# EAGLE schematic astra (EAGLE 9.6.2)

## Sheet 1 of 7: System architecture and design index
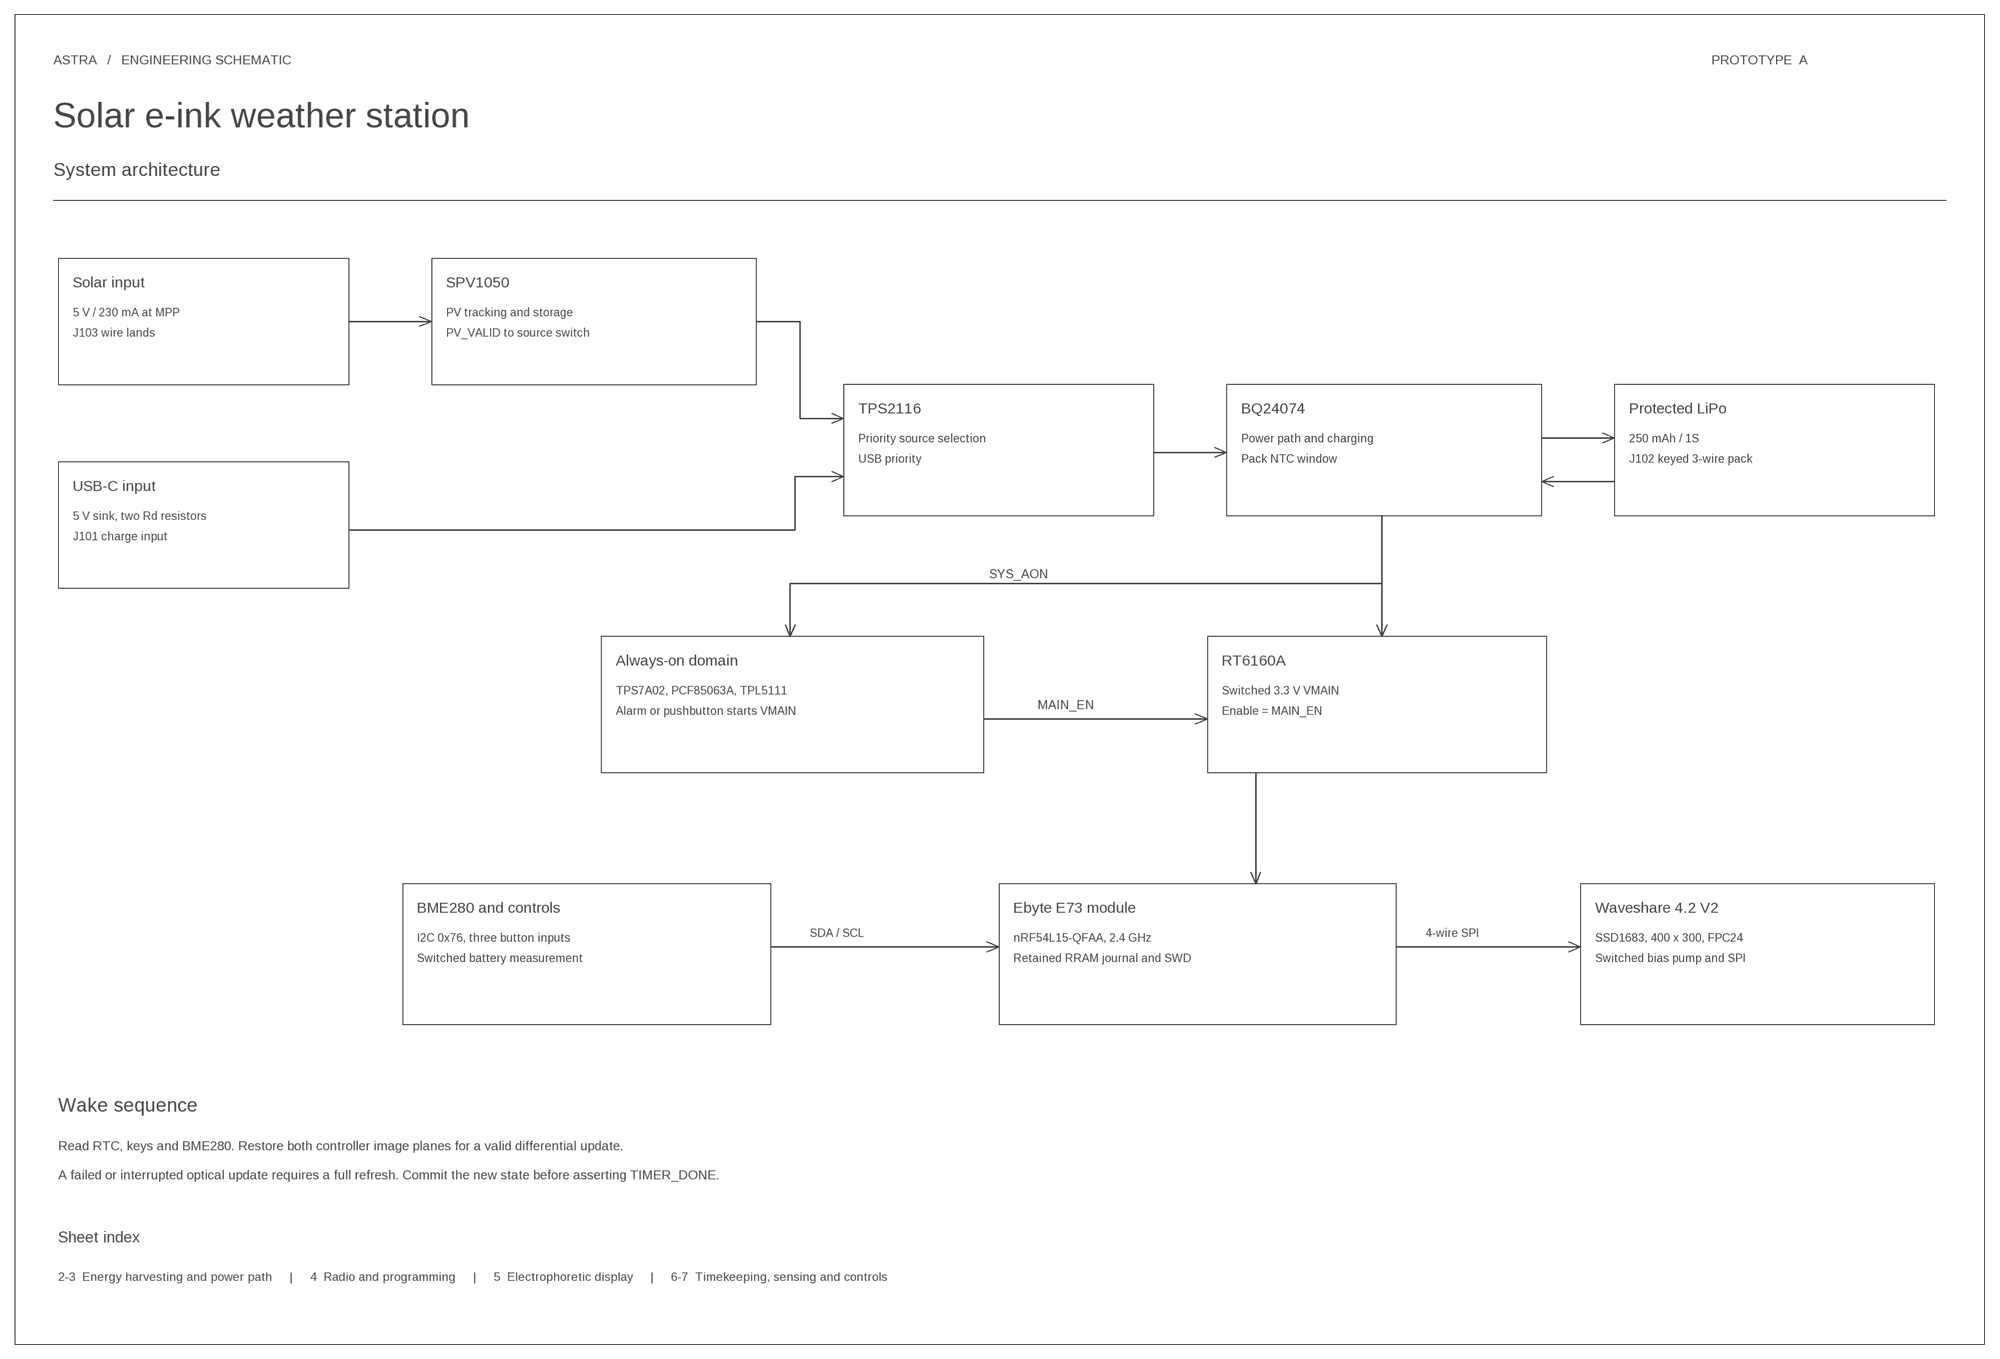
[diagram p0: schematic, sheet 1]

### Notes on the sheet
- ASTRA   /   ENGINEERING SCHEMATIC | PROTOTYPE  A
- Solar e-ink weather station
- System architecture
- Solar input | SPV1050
- 5 V / 230 mA at MPP | PV tracking and storage
- J103 wire lands | PV_VALID to source switch
- TPS2116 | BQ24074 | Protected LiPo
- Priority source selection | Power path and charging | 250 mAh / 1S
- USB priority | Pack NTC window | J102 keyed 3-wire pack
- USB-C input
- 5 V sink, two Rd resistors
- J101 charge input
- SYS_AON
- Always-on domain | RT6160A
- TPS7A02, PCF85063A, TPL5111 | Switched 3.3 V VMAIN
- MAIN_EN
- Alarm or pushbutton starts VMAIN | Enable = MAIN_EN
- BME280 and controls | Ebyte E73 module | Waveshare 4.2 V2
- SDA / SCL | 4-wire SPI
- I2C 0x76, three button inputs | nRF54L15-QFAA, 2.4 GHz | SSD1683, 400 x 300, FPC24
- Switched battery measurement | Retained RRAM journal and SWD | Switched bias pump and SPI
- Wake sequence
- Read RTC, keys and BME280. Restore both controller image planes for a valid differential update.
- A failed or interrupted optical update requires a full refresh. Commit the new state before asserting TIMER_DONE.
- Sheet index
- 2-3  Energy harvesting and power path     |     4  Radio and programming     |     5  Electrophoretic display     |     6-7  Timekeeping, sensing and controls

## Sheet 2 of 7: USB-C, battery charging and system rail
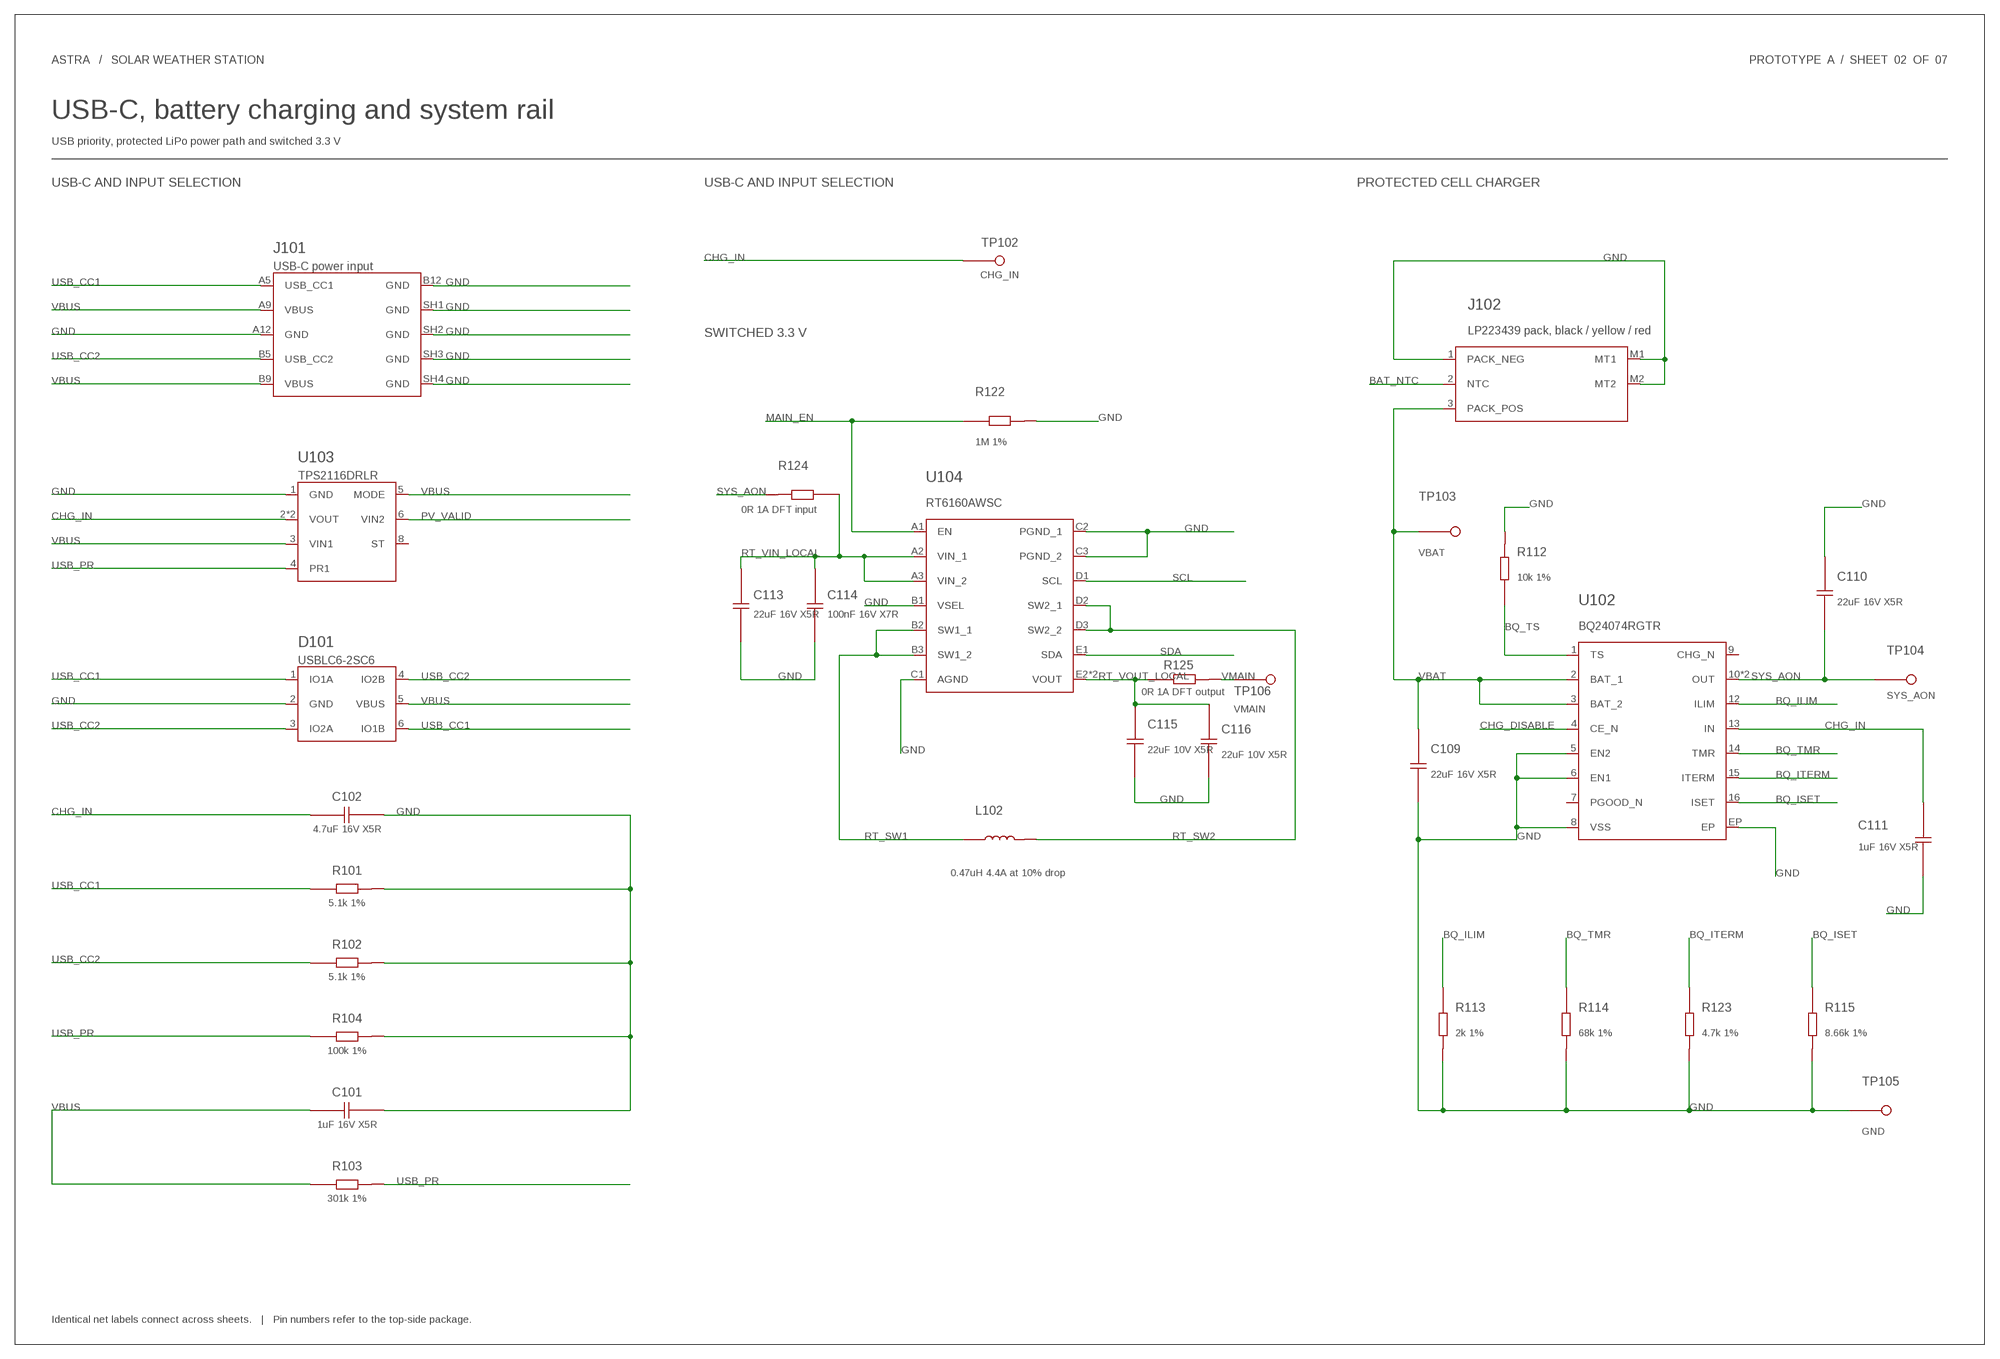
[diagram p1: schematic, sheet 2]

### Parts
C101  1uF 16V X5R  C_C0402  [C0402]
C102  4.7uF 16V X5R  C_C0603  [C0603]
C109  22uF 16V X5R  C_C0603  [C0603]
C110  22uF 16V X5R  C_C0603  [C0603]
C111  1uF 16V X5R  C_C0402  [C0402]
C113  22uF 16V X5R  C_C0603  [C0603]
C114  100nF 16V X7R  C_C0402  [C0402]
C115  22uF 10V X5R  C_C0603  [C0603]
C116  22uF 10V X5R  C_C0603  [C0603]
D101  USBLC6-2SC6  [ST_SOT23_6_ESD]
J101  USB-C power input  USB4135-GF-A  [GCT_USB4135]
J102  LP223439 pack, black / yellow / red  BM03B-ACHSS-GAN-ETF_LF__SN  [JST_ACH03P_POWER]
L102  0.47uH 4.4A at 10% drop  L_COIL_XGL4015  [COIL_XGL4015]
R101  5.1k 1%  R_R0402  [R0402]
R102  5.1k 1%  R_R0402  [R0402]
R103  301k 1%  R_R0402  [R0402]
R104  100k 1%  R_R0402  [R0402]
R112  10k 1%  R_R0402  [R0402]
R113  2k 1%  R_R0402  [R0402]
R114  68k 1%  R_R0402  [R0402]
R115  8.66k 1%  R_R0402  [R0402]
R122  1M 1%  R_R0402  [R0402]
R123  4.7k 1%  R_R0402  [R0402]
R124  0R 1A DFT input  R_R0603  [R0603]
R125  0R 1A DFT output  R_R0603  [R0603]
TP102  CHG_IN  TP_TP  [TP]
TP103  VBAT  TP_TP  [TP]
TP104  SYS_AON  TP_TP  [TP]
TP105  GND  TP_TP  [TP]
TP106  VMAIN  TP_TP  [TP]
U102  BQ24074RGTR  [TI_RGT16_BQ74]
U103  TPS2116DRLR  [TI_DRL8_MUX]
U104  RT6160AWSC  [RT_WLCSP15]

### Nets
BAT_NTC: J102.2(NTC) ; also sheet 3
BQ_ILIM: R113.1 U102.12(ILIM)
BQ_ISET: R115.1 U102.16(ISET)
BQ_ITERM: R123.1 U102.15(ITERM)
BQ_TMR: R114.1 U102.14(TMR)
BQ_TS: R112.1 U102.1(TS)
CHG_DISABLE: U102.4(CE_N) ; also sheet 3
CHG_IN: C102.1 C111.1 TP102.1 U102.13(IN) U103.2(VOUT) U103.7(VOUT) ; also sheet 3
GND: C101.2 C102.2 C109.2 C110.2 C111.2 C113.2 C114.2 C115.2 C116.2 D101.2(GND) J101.A12(GND) J101.B12(GND) J101.SH1(GND) J101.SH2(GND) J101.SH3(GND) J101.SH4(GND) J102.1(PACK_NEG) J102.M1(MT1) J102.M2(MT2) R101.2 R102.2 R104.2 R112.2 R113.2 R114.2 R115.2 R122.2 R123.2 TP105.1 U102.5(EN2) U102.6(EN1) U102.8(VSS) U102.EP U103.1(GND) U104.B1(VSEL) U104.C1(AGND) U104.C2(PGND_1) U104.C3(PGND_2) ; also sheet 3,4,5,6,7
MAIN_EN: R122.1 U104.A1(EN) ; also sheet 6,7
PV_VALID: U103.6(VIN2) ; also sheet 3
RT_SW1: L102.1 U104.B2(SW1_1) U104.B3(SW1_2)
RT_SW2: L102.2 U104.D2(SW2_1) U104.D3(SW2_2)
RT_VIN_LOCAL: C113.1 C114.1 R124.1 U104.A2(VIN_1) U104.A3(VIN_2)
RT_VOUT_LOCAL: C115.1 C116.1 R125.1 U104.E2(VOUT) U104.E3(VOUT)
SCL: U104.D1(SCL) ; also sheet 4,6
SDA: U104.E1(SDA) ; also sheet 4,6
SYS_AON [power]: C110.1 R124.2 TP104.1 U102.10(OUT) U102.11(OUT) ; also sheet 6
USB_CC1: D101.1(IO1A) D101.6(IO1B) J101.A5(USB_CC1) R101.1
USB_CC2: D101.3(IO2A) D101.4(IO2B) J101.B5(USB_CC2) R102.1
USB_PR: R103.2 R104.1 U103.4(PR1)
VBAT [power]: C109.1 J102.3(PACK_POS) TP103.1 U102.2(BAT_1) U102.3(BAT_2) ; also sheet 7
VBUS [power]: C101.1 D101.5(VBUS) J101.A9(VBUS) J101.B9(VBUS) R103.1 U103.3(VIN1) U103.5(MODE)
VMAIN [power]: R125.2 TP106.1 ; also sheet 4,5,6,7
Unconnected: U102.7(PGOOD_N) U102.9(CHG_N) U103.8(ST)

### Notes on the sheet
- ASTRA   /   SOLAR WEATHER STATION | PROTOTYPE  A  /  SHEET  02  OF  07
- USB-C, battery charging and system rail
- USB priority, protected LiPo power path and switched 3.3 V
- USB-C AND INPUT SELECTION | USB-C AND INPUT SELECTION | PROTECTED CELL CHARGER
- SWITCHED 3.3 V
- Identical net labels connect across sheets.   |   Pin numbers refer to the top-side package.

## Sheet 3 of 7: Solar harvesting and pack temperature
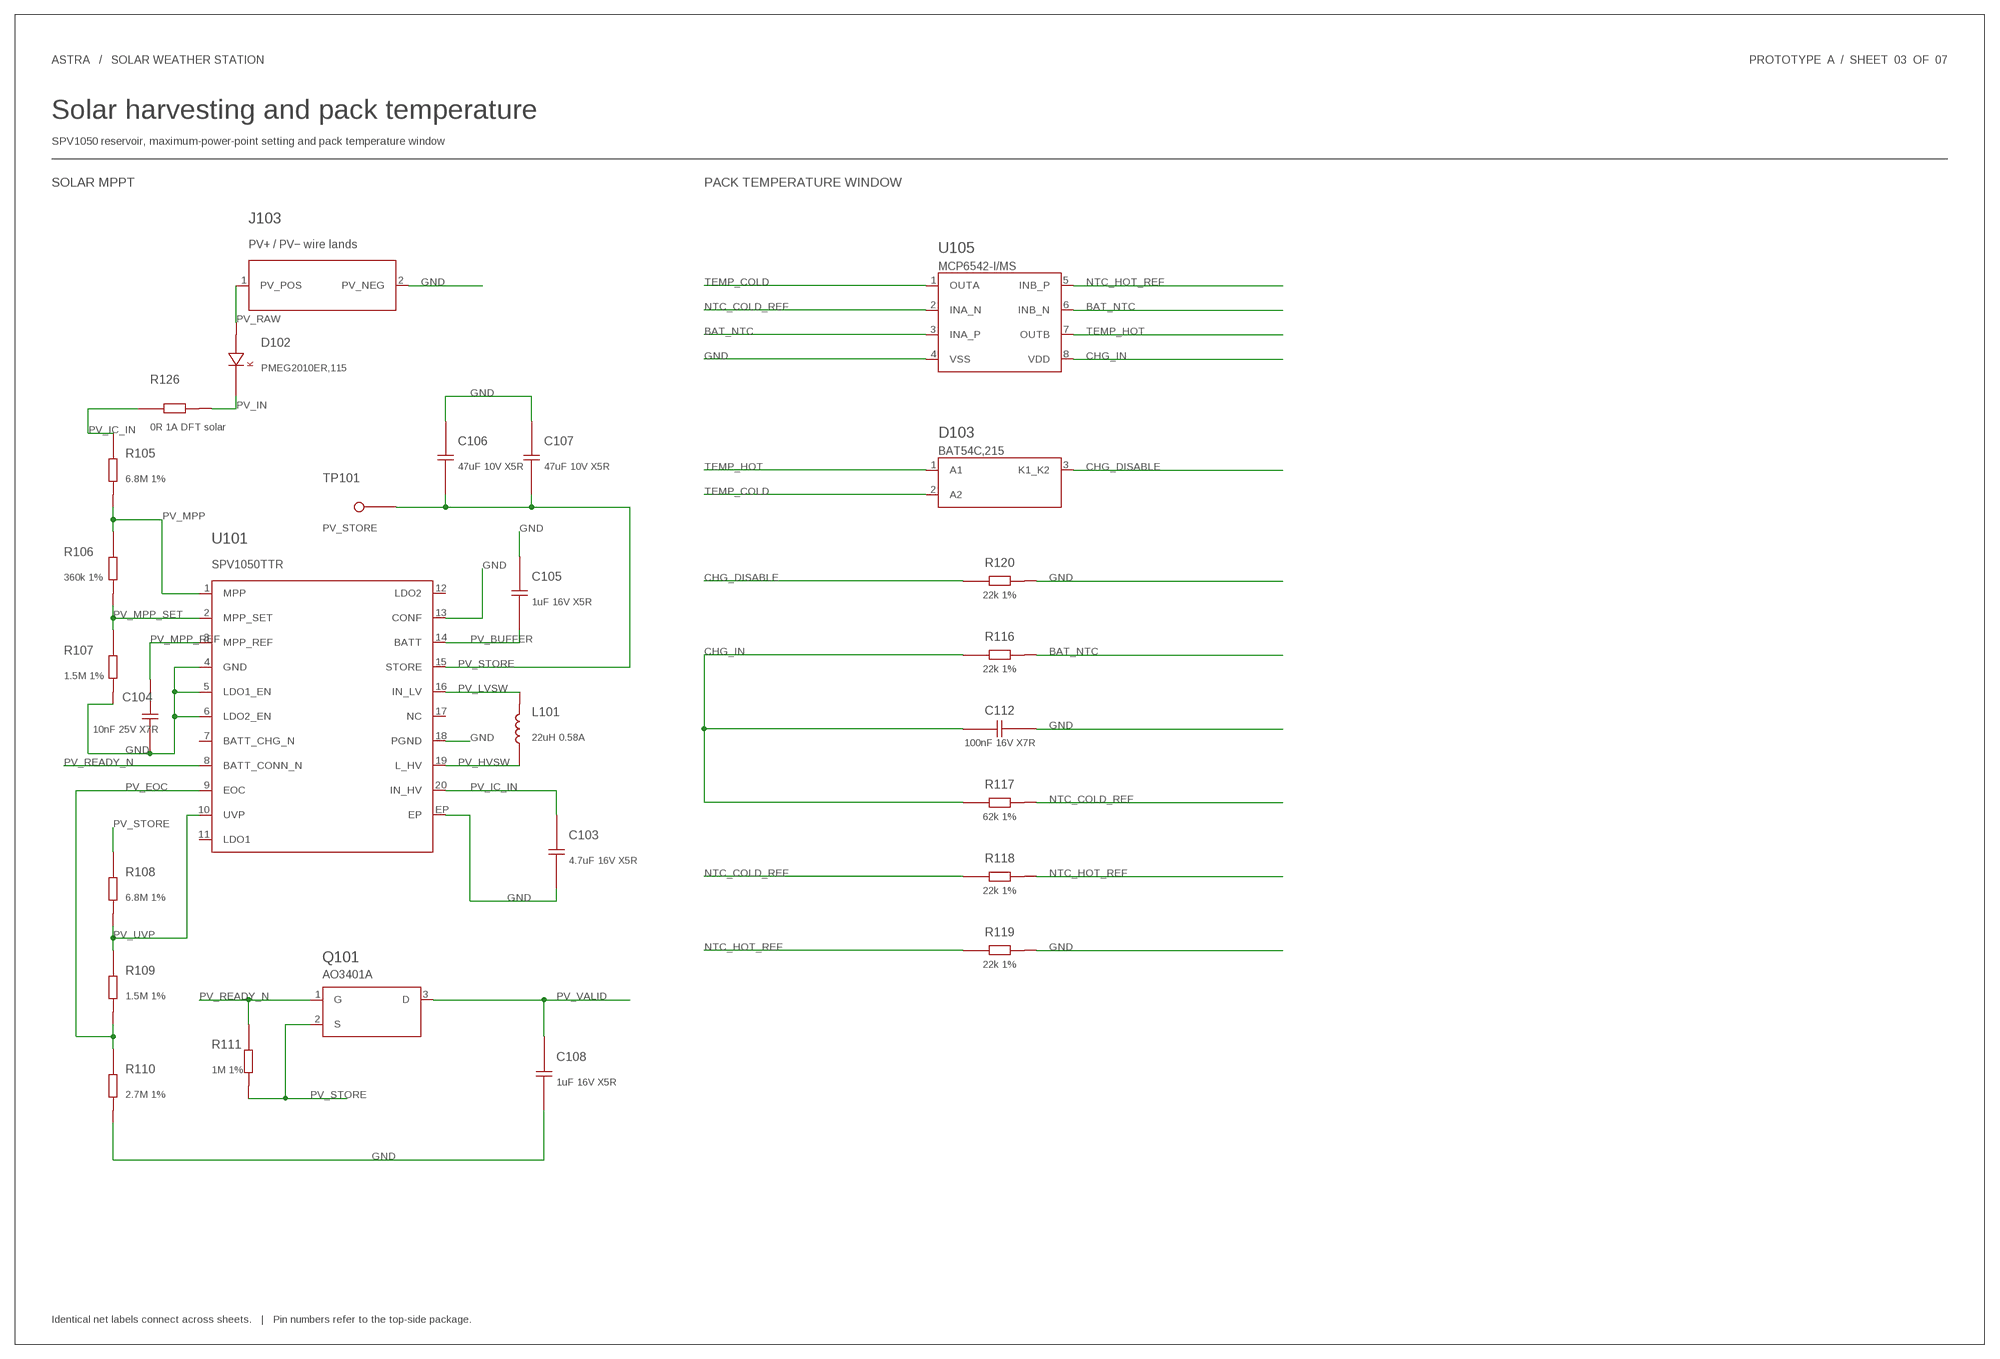
[diagram p2: schematic, sheet 3]

### Parts
C103  4.7uF 16V X5R  C_C0603  [C0603]
C104  10nF 25V X7R  C_C0402  [C0402]
C105  1uF 16V X5R  C_C0402  [C0402]
C106  47uF 10V X5R  C_C1206P  [C1206P]
C107  47uF 10V X5R  C_C1206P  [C1206P]
C108  1uF 16V X5R  C_C0402  [C0402]
C112  100nF 16V X7R  C_C0402  [C0402]
D102  PMEG2010ER,115  D_NXP_CFP3_DIODE  [NXP_CFP3_DIODE]
D103  BAT54C,215  BAT54C_215  [NXP_SOT23_DIODE]
J103  PV+ / PV− wire lands  PCB-FEATURE  [PV_WIRE_PAIR]
L101  22uH 0.58A  L_BOURNS_SRN3015  [BOURNS_SRN3015]
Q101  AO3401A  [SOT23_AO3401A]
R105  6.8M 1%  R_R0402  [R0402]
R106  360k 1%  R_R0402  [R0402]
R107  1.5M 1%  R_R0402  [R0402]
R108  6.8M 1%  R_R0402  [R0402]
R109  1.5M 1%  R_R0402  [R0402]
R110  2.7M 1%  R_R0402  [R0402]
R111  1M 1%  R_R0402  [R0402]
R116  22k 1%  R_R0402  [R0402]
R117  62k 1%  R_R0402  [R0402]
R118  22k 1%  R_R0402  [R0402]
R119  22k 1%  R_R0402  [R0402]
R120  22k 1%  R_R0402  [R0402]
R126  0R 1A DFT solar  R_R0603  [R0603]
TP101  PV_STORE  TP_TP  [TP]
U101  SPV1050TTR  [SPV_VFQFPN20]
U105  MCP6542-I/MS  [MC_MSOP8_TEMP]

### Nets
BAT_NTC: R116.2 U105.3(INA_P) U105.6(INB_N) ; also sheet 2
CHG_DISABLE: D103.3(K1_K2) R120.1 ; also sheet 2
CHG_IN: C112.1 R116.1 R117.1 U105.8(VDD) ; also sheet 2
GND: C103.2 C104.2 C105.2 C106.2 C107.2 C108.2 C112.2 J103.2(PV_NEG) R107.2 R110.2 R119.2 R120.2 U101.4(GND) U101.5(LDO1_EN) U101.6(LDO2_EN) U101.13(CONF) U101.18(PGND) U101.EP U105.4(VSS) ; also sheet 2,4,5,6,7
NTC_COLD_REF: R117.2 R118.1 U105.2(INA_N)
NTC_HOT_REF: R118.2 R119.1 U105.5(INB_P)
PV_BUFFER: C105.1 U101.14(BATT)
PV_EOC: R109.2 R110.1 U101.9(EOC)
PV_HVSW: L101.1 U101.19(L_HV)
PV_IC_IN: C103.1 R105.1 R126.1 U101.20(IN_HV)
PV_IN [power]: D102.1(K) R126.2
PV_LVSW: L101.2 U101.16(IN_LV)
PV_MPP: R105.2 R106.1 U101.1(MPP)
PV_MPP_REF: C104.1 U101.3(MPP_REF)
PV_MPP_SET: R106.2 R107.1 U101.2(MPP_SET)
PV_RAW: D102.2(A) J103.1(PV_POS)
PV_READY_N: Q101.1(G) R111.1 U101.8(BATT_CONN_N)
PV_STORE: C106.1 C107.1 Q101.2(S) R108.1 R111.2 TP101.1 U101.15(STORE)
PV_UVP: R108.2 R109.1 U101.10(UVP)
PV_VALID: C108.1 Q101.3(D) ; also sheet 2
TEMP_COLD: D103.2(A2) U105.1(OUTA)
TEMP_HOT: D103.1(A1) U105.7(OUTB)
Unconnected: U101.7(BATT_CHG_N) U101.11(LDO1) U101.12(LDO2) U101.17(NC)

### Notes on the sheet
- ASTRA   /   SOLAR WEATHER STATION | PROTOTYPE  A  /  SHEET  03  OF  07
- Solar harvesting and pack temperature
- SPV1050 reservoir, maximum-power-point setting and pack temperature window
- SOLAR MPPT | PACK TEMPERATURE WINDOW
- Identical net labels connect across sheets.   |   Pin numbers refer to the top-side package.

## Sheet 4 of 7: Radio and programming
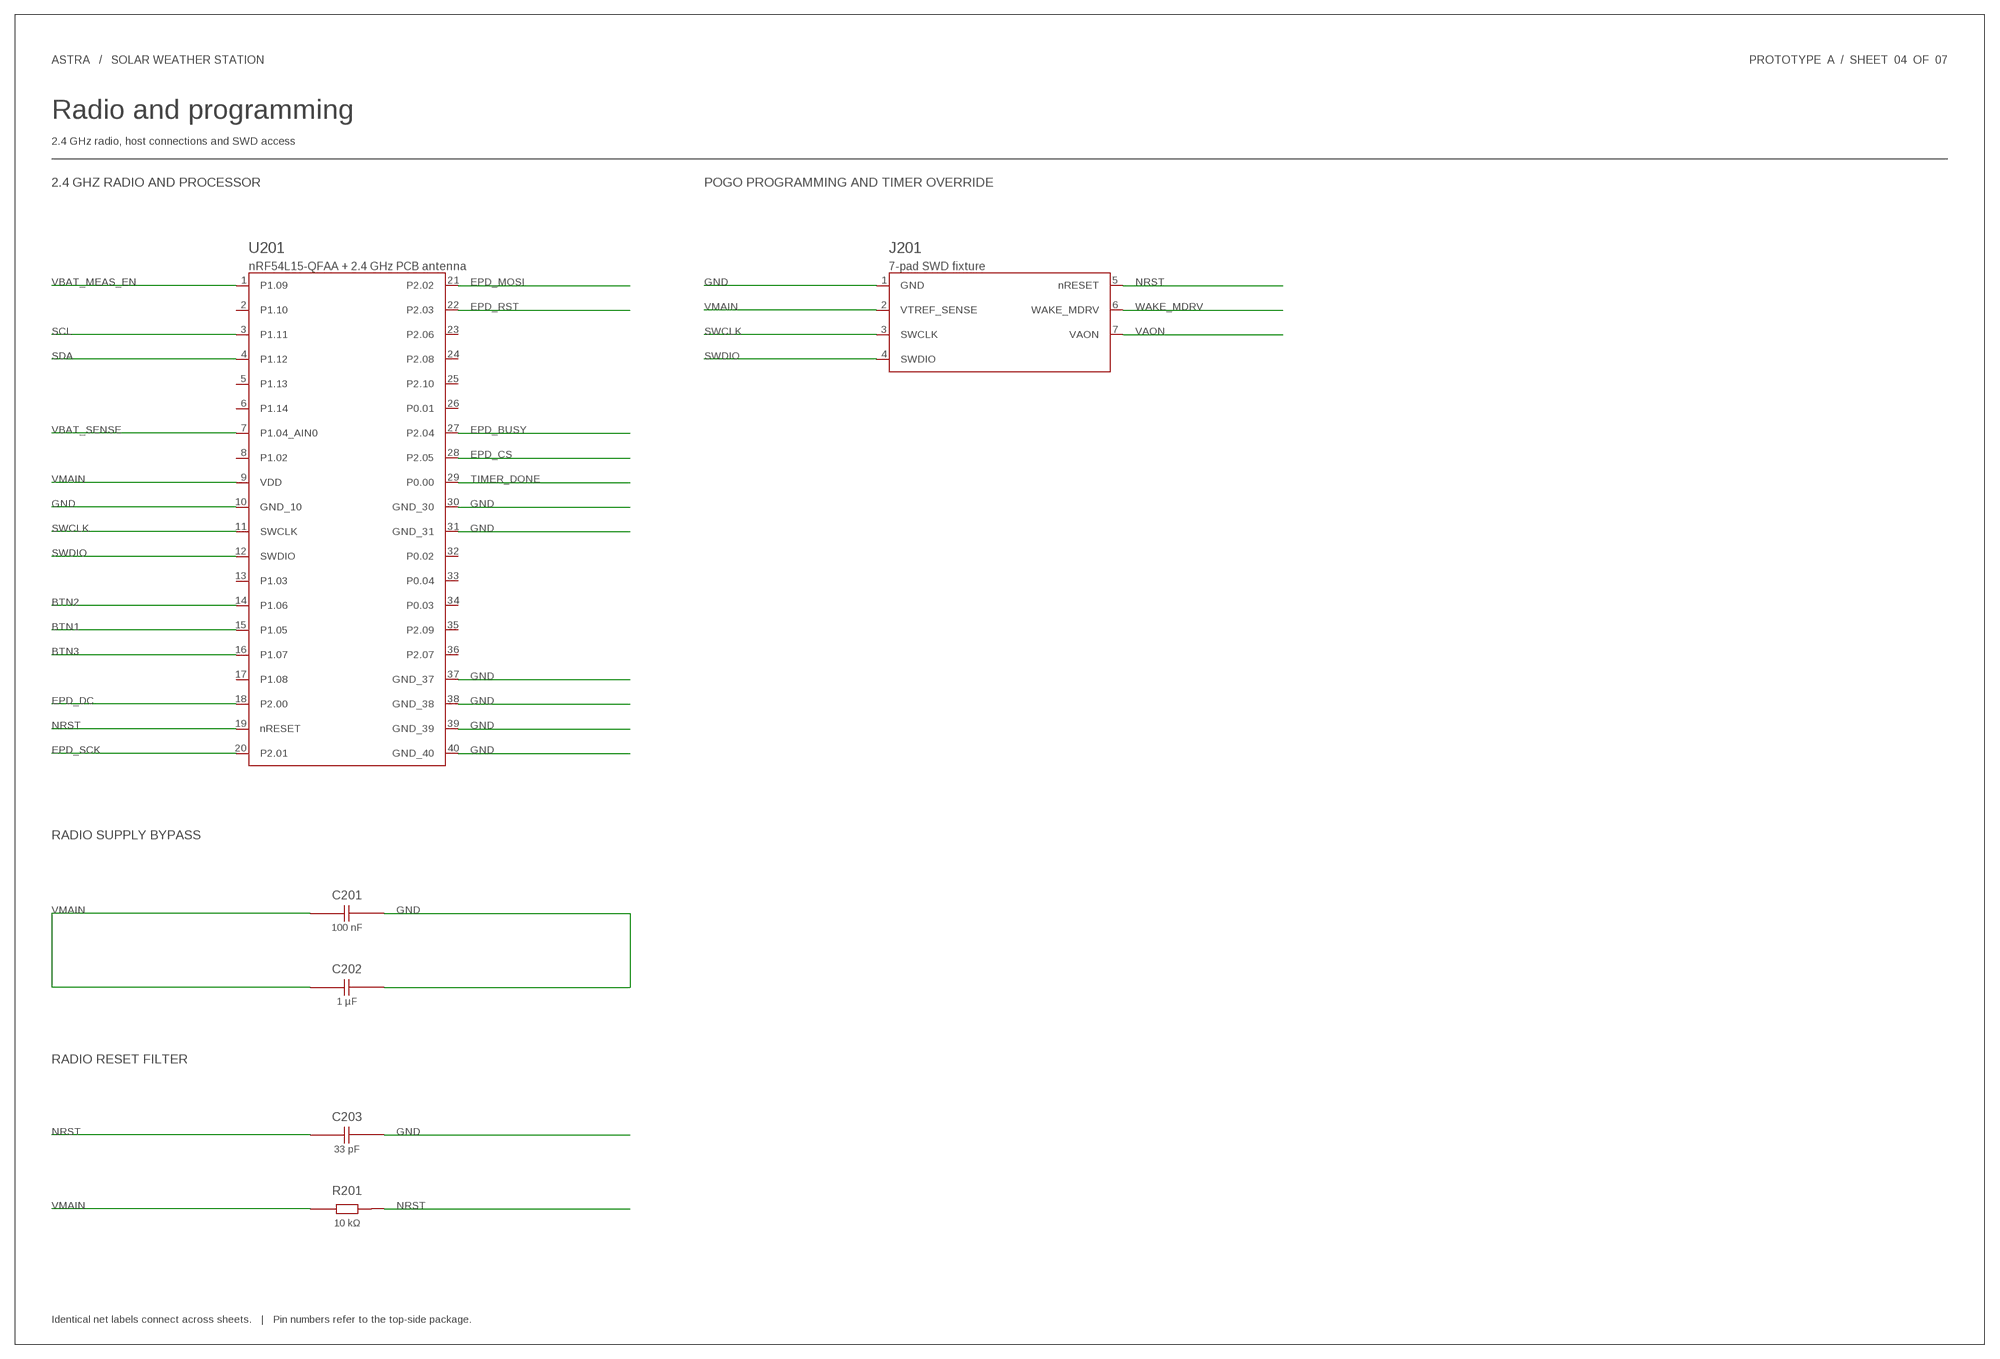
[diagram p3: schematic, sheet 4]

### Parts
C201  100 nF  C_C0402  [C0402]
C202  1 µF  C_C0402  [C0402]
C203  33 pF  C_C0402  [C0402]
J201  7-pad SWD fixture  PCB_pads_only  [SWD_FIXTURE_7]
R201  10 kΩ  R_R0402  [R0402]
U201  nRF54L15-QFAA + 2.4 GHz PCB antenna  E73-2G4M08S1F  [EBYTE_08S1F_LGA40]

### Nets
BTN1: U201.15(P1.05) ; also sheet 7
BTN2: U201.14(P1.06) ; also sheet 7
BTN3: U201.16(P1.07) ; also sheet 7
EPD_BUSY: U201.27(P2.04) ; also sheet 5
EPD_CS: U201.28(P2.05) ; also sheet 5
EPD_DC: U201.18(P2.00) ; also sheet 5
EPD_MOSI: U201.21(P2.02) ; also sheet 5
EPD_RST: U201.22(P2.03) ; also sheet 5
EPD_SCK: U201.20(P2.01) ; also sheet 5
GND: C201.2 C202.2 C203.2 J201.1(GND) U201.10(GND_10) U201.30(GND_30) U201.31(GND_31) U201.37(GND_37) U201.38(GND_38) U201.39(GND_39) U201.40(GND_40) ; also sheet 2,3,5,6,7
NRST: C203.1 J201.5(nRESET) R201.2 U201.19(nRESET)
SCL: U201.3(P1.11) ; also sheet 2,6
SDA: U201.4(P1.12) ; also sheet 2,6
SWCLK: J201.3(SWCLK) U201.11(SWCLK)
SWDIO: J201.4(SWDIO) U201.12(SWDIO)
TIMER_DONE: U201.29(P0.00) ; also sheet 6
VAON: J201.7(VAON) ; also sheet 6,7
VBAT_MEAS_EN: U201.1(P1.09) ; also sheet 7
VBAT_SENSE: U201.7(P1.04_AIN0) ; also sheet 7
VMAIN [power]: C201.1 C202.1 J201.2(VTREF_SENSE) R201.1 U201.9(VDD) ; also sheet 2,5,6,7
WAKE_MDRV: J201.6(WAKE_MDRV) ; also sheet 6
Unconnected: U201.2(P1.10) U201.5(P1.13) U201.6(P1.14) U201.8(P1.02) U201.13(P1.03) U201.17(P1.08) U201.23(P2.06) U201.24(P2.08) U201.25(P2.10) U201.26(P0.01) U201.32(P0.02) U201.33(P0.04) U201.34(P0.03) U201.35(P2.09) U201.36(P2.07)

### Notes on the sheet
- ASTRA   /   SOLAR WEATHER STATION | PROTOTYPE  A  /  SHEET  04  OF  07
- Radio and programming
- 2.4 GHz radio, host connections and SWD access
- 2.4 GHZ RADIO AND PROCESSOR | POGO PROGRAMMING AND TIMER OVERRIDE
- RADIO SUPPLY BYPASS
- RADIO RESET FILTER
- Identical net labels connect across sheets.   |   Pin numbers refer to the top-side package.

## Sheet 5 of 7: Electrophoretic display
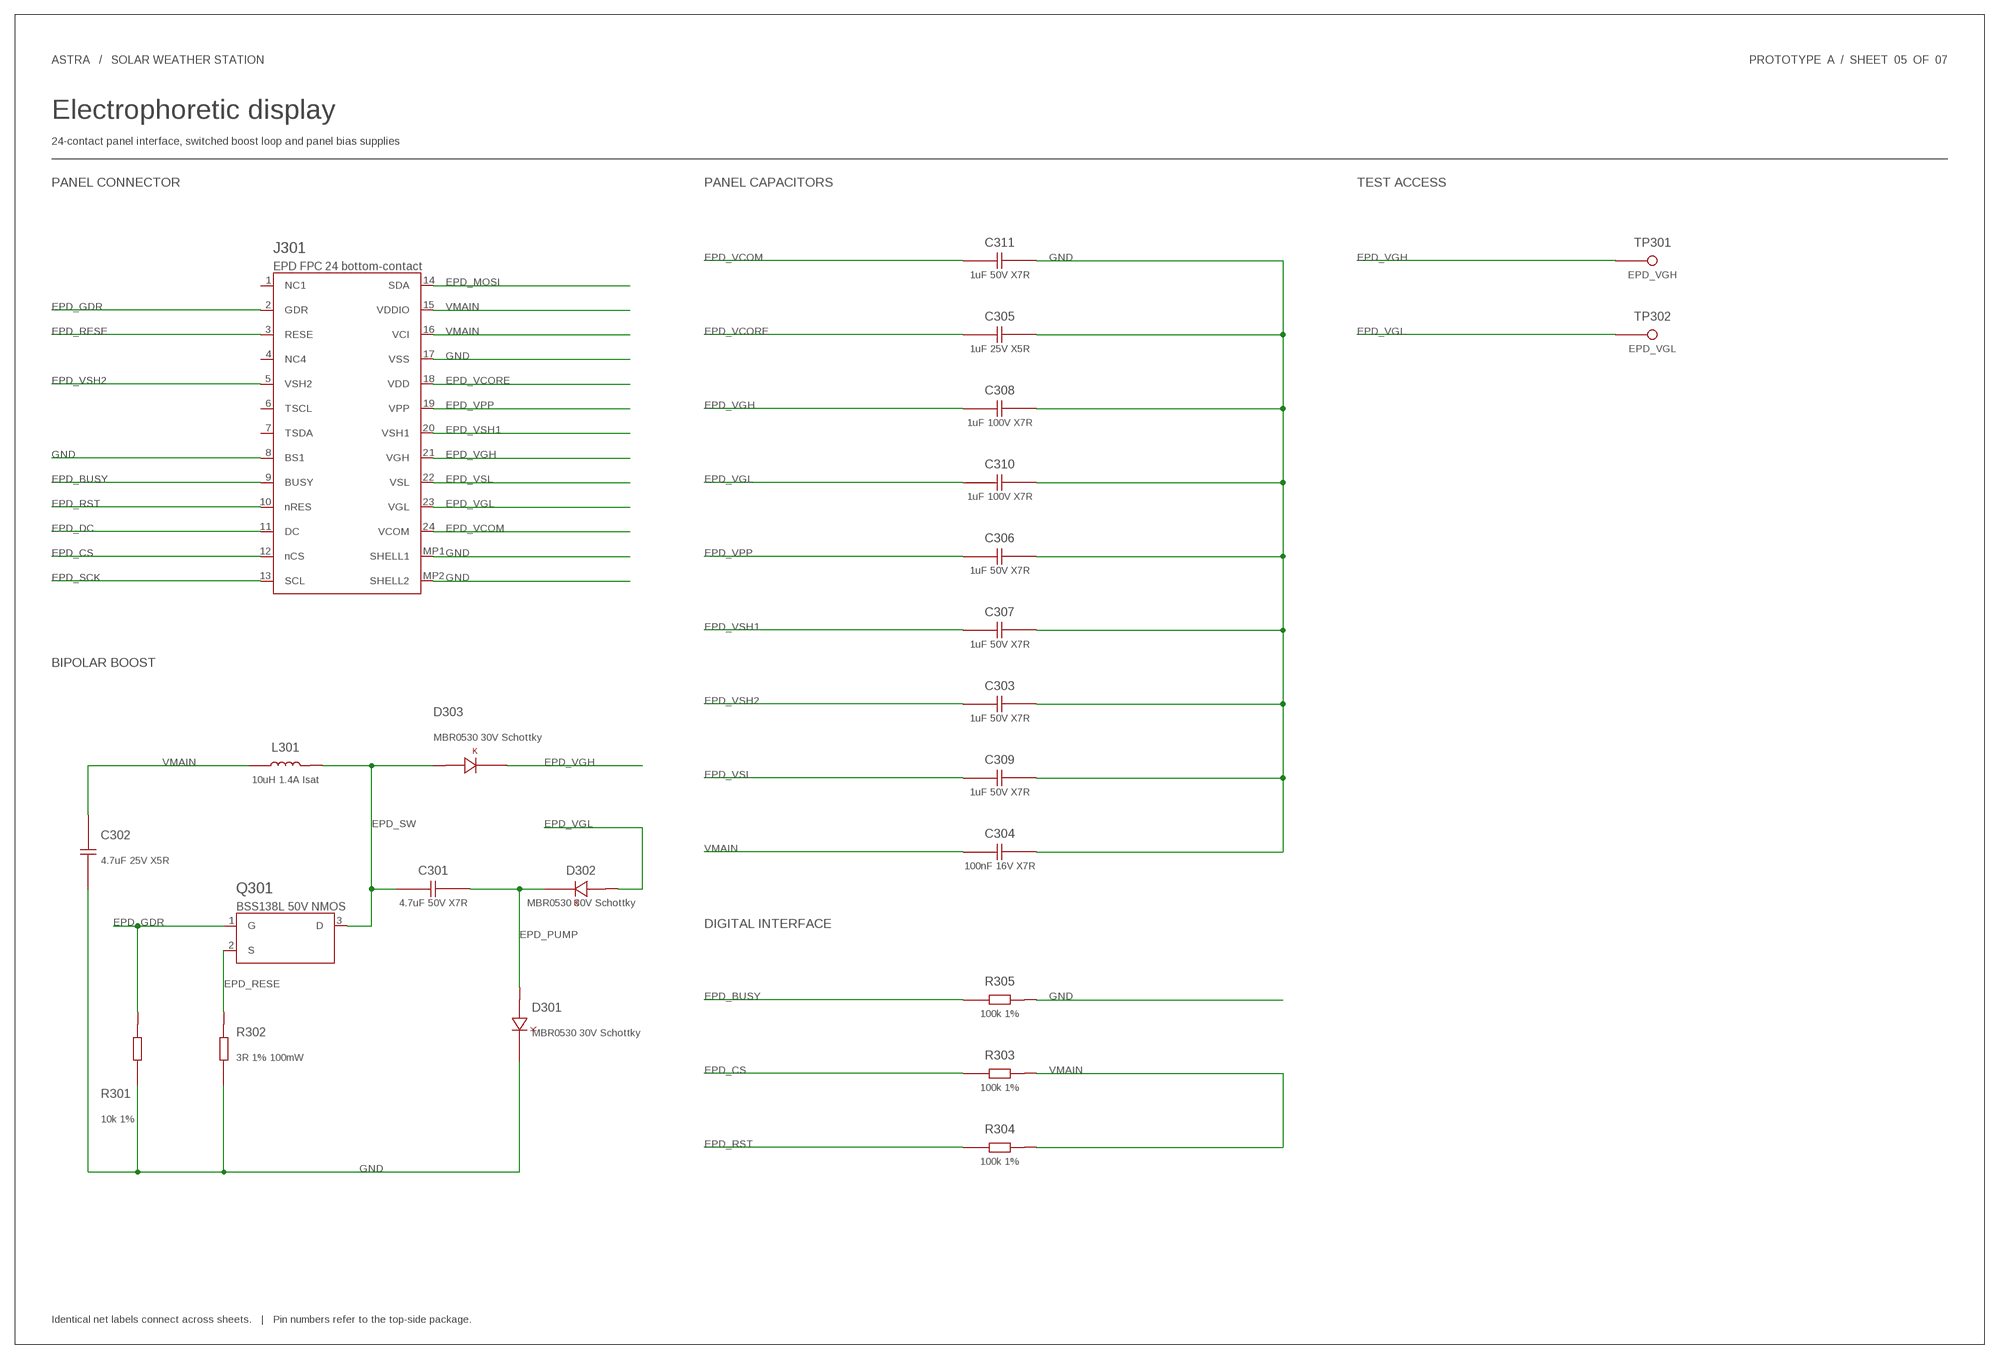
[diagram p4: schematic, sheet 5]

### Parts
C301  4.7uF 50V X7R  C_EPD_C1210  [EPD_C1210]
C302  4.7uF 25V X5R  C_C0805  [C0805]
C303  1uF 50V X7R  C_C0805  [C0805]
C304  100nF 16V X7R  C_C0402  [C0402]
C305  1uF 25V X5R  C_C0402  [C0402]
C306  1uF 50V X7R  C_C0805  [C0805]
C307  1uF 50V X7R  C_C0805  [C0805]
C308  1uF 100V X7R  C_EPD_C1206  [EPD_C1206]
C309  1uF 50V X7R  C_C0805  [C0805]
C310  1uF 100V X7R  C_EPD_C1206  [EPD_C1206]
C311  1uF 50V X7R  C_C0805  [C0805]
D301  MBR0530 30V Schottky  D_MBR0530_CASE425  [MBR0530_CASE425]
D302  MBR0530 30V Schottky  D_MBR0530_CASE425  [MBR0530_CASE425]
D303  MBR0530 30V Schottky  D_MBR0530_CASE425  [MBR0530_CASE425]
J301  EPD FPC 24 bottom-contact  FH12-24S-0.5SH_55  [FH12_24S_05SH]
L301  10uH 1.4A Isat  L_SRN4018  [SRN4018]
Q301  BSS138L 50V NMOS  BSS138LT1G  [BSS138_CASE318]
R301  10k 1%  R_R0402  [R0402]
R302  3R 1% 100mW  R_R0603  [R0603]
R303  100k 1%  R_R0402  [R0402]
R304  100k 1%  R_R0402  [R0402]
R305  100k 1%  R_R0402  [R0402]
TP301  EPD_VGH  TP_TP_4BE49  [TP]
TP302  EPD_VGL  TP_TP_CC413  [TP]

### Nets
EPD_BUSY: J301.9(BUSY) R305.1 ; also sheet 4
EPD_CS: J301.12(nCS) R303.1 ; also sheet 4
EPD_DC: J301.11(DC) ; also sheet 4
EPD_GDR: J301.2(GDR) Q301.1(G) R301.2
EPD_MOSI: J301.14(SDA) ; also sheet 4
EPD_PUMP: C301.2 D301.2(A) D302.1(K)
EPD_RESE: J301.3(RESE) Q301.2(S) R302.2
EPD_RST: J301.10(nRES) R304.1 ; also sheet 4
EPD_SCK: J301.13(SCL) ; also sheet 4
EPD_SW: C301.1 D303.2(A) L301.2 Q301.3(D)
EPD_VCOM: C311.1 J301.24(VCOM)
EPD_VCORE: C305.1 J301.18(VDD)
EPD_VGH: C308.1 D303.1(K) J301.21(VGH) TP301.1(EPD_VGH)
EPD_VGL: C310.1 D302.2(A) J301.23(VGL) TP302.1(EPD_VGL)
EPD_VPP: C306.1 J301.19(VPP)
EPD_VSH1: C307.1 J301.20(VSH1)
EPD_VSH2: C303.1 J301.5(VSH2)
EPD_VSL: C309.1 J301.22(VSL)
GND: C302.2 C303.2 C304.2 C305.2 C306.2 C307.2 C308.2 C309.2 C310.2 C311.2 D301.1(K) J301.8(BS1) J301.17(VSS) J301.MP1(SHELL1) J301.MP2(SHELL2) R301.1 R302.1 R305.2 ; also sheet 2,3,4,6,7
VMAIN [power]: C302.1 C304.1 J301.15(VDDIO) J301.16(VCI) L301.1 R303.2 R304.2 ; also sheet 2,4,6,7
Unconnected: J301.1(NC1) J301.4(NC4) J301.6(TSCL) J301.7(TSDA)

### Notes on the sheet
- ASTRA   /   SOLAR WEATHER STATION | PROTOTYPE  A  /  SHEET  05  OF  07
- Electrophoretic display
- 24-contact panel interface, switched boost loop and panel bias supplies
- PANEL CONNECTOR | PANEL CAPACITORS | TEST ACCESS
- BIPOLAR BOOST
- DIGITAL INTERFACE
- Identical net labels connect across sheets.   |   Pin numbers refer to the top-side package.

## Sheet 6 of 7: Wake timing, clock and ambient sensor
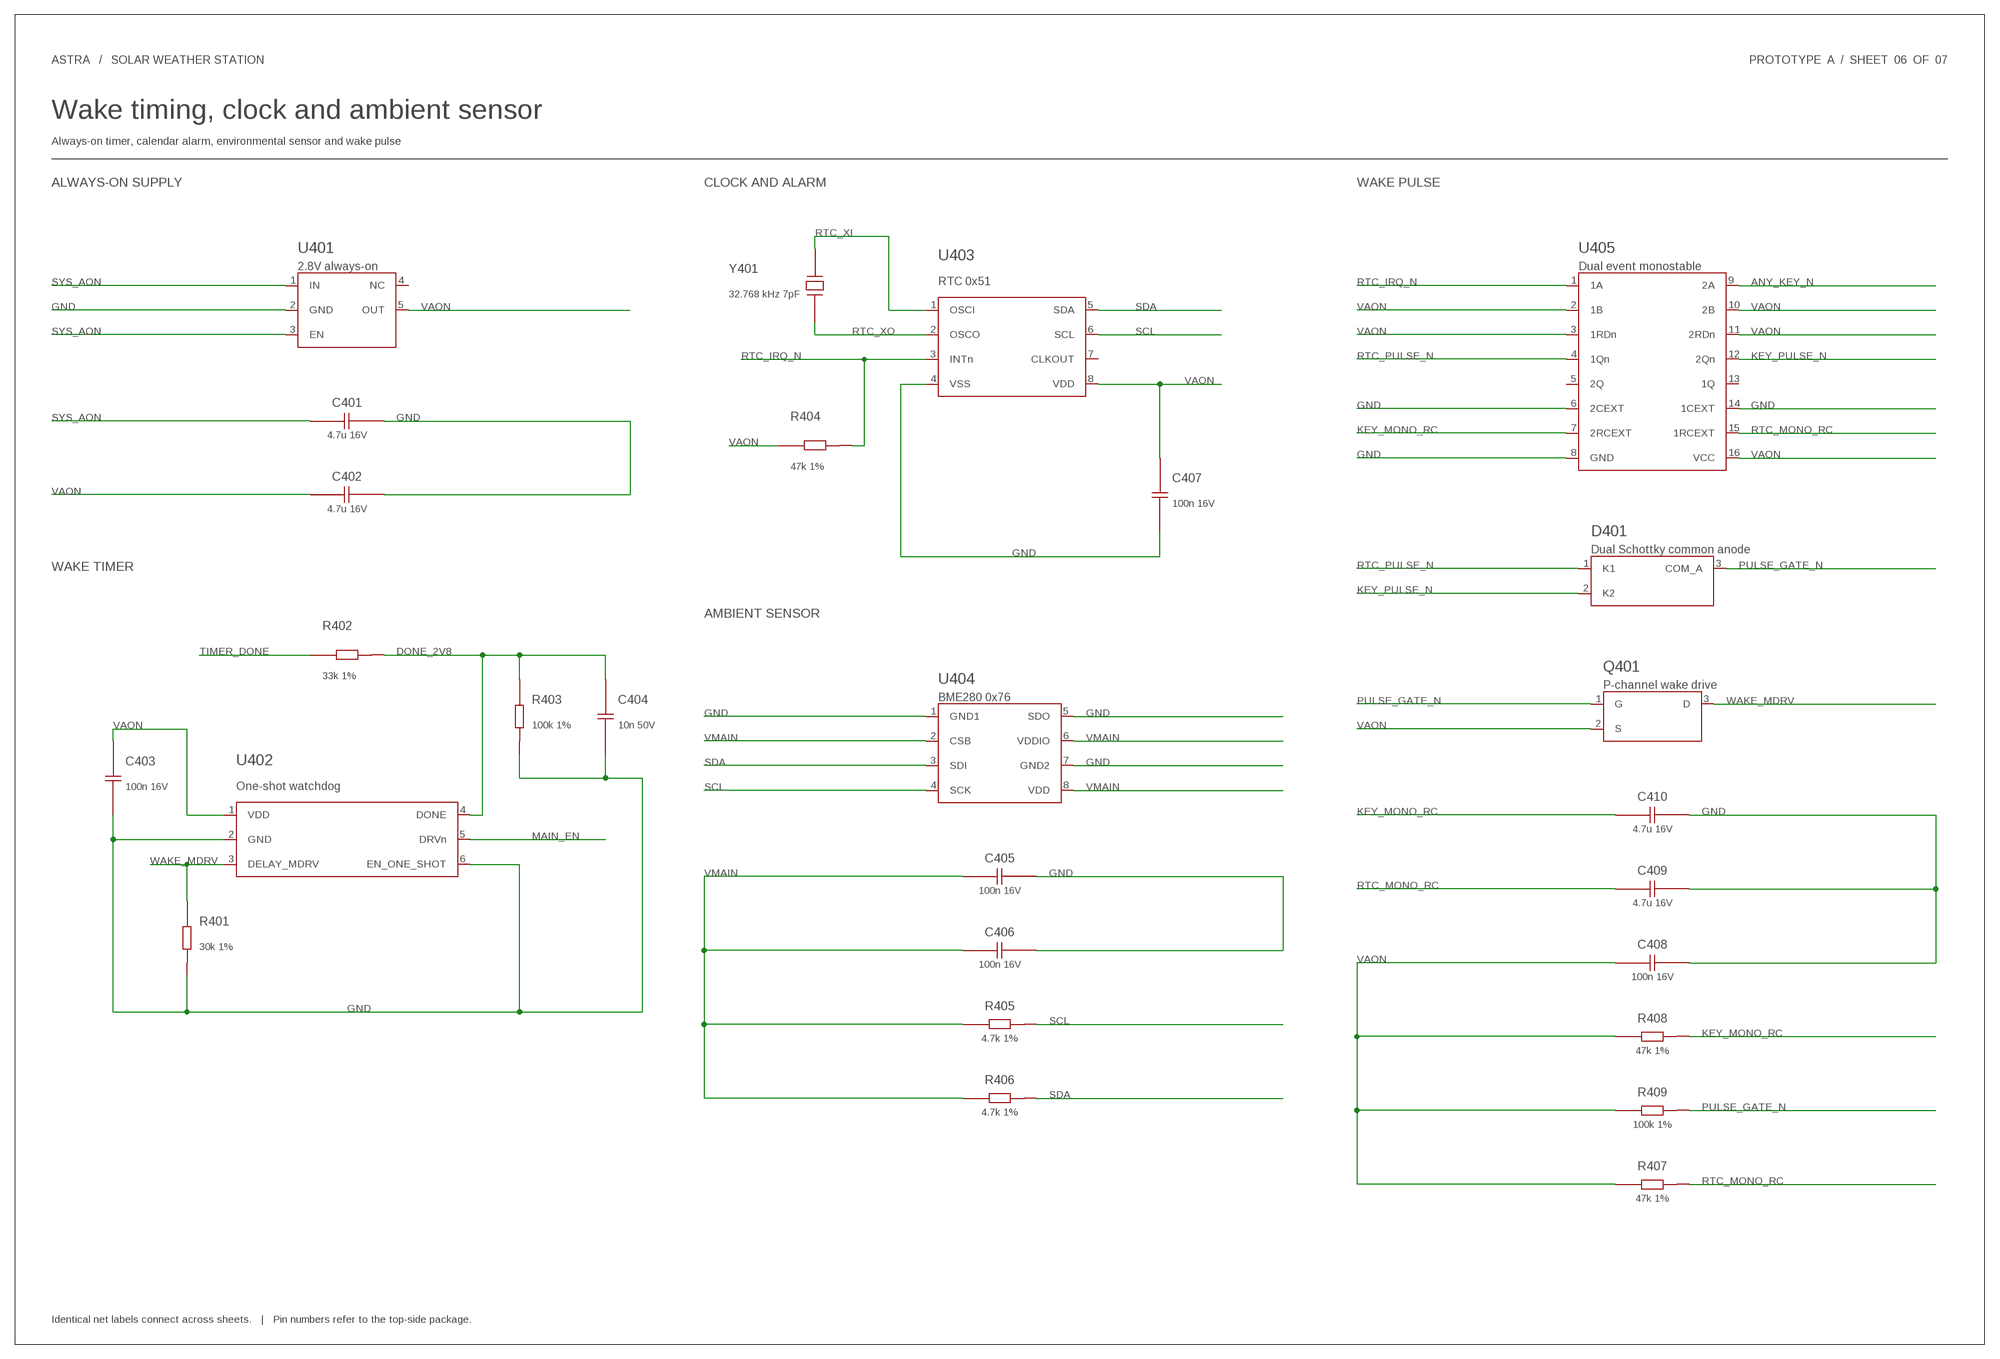
[diagram p5: schematic, sheet 6]

### Parts
C401  4.7u 16V  C_C0805  [C0805]
C402  4.7u 16V  C_C0805  [C0805]
C403  100n 16V  C_C0402  [C0402]
C404  10n 50V  C_C0402  [C0402]
C405  100n 16V  C_C0402  [C0402]
C406  100n 16V  C_C0402  [C0402]
C407  100n 16V  C_C0402  [C0402]
C408  100n 16V  C_C0402  [C0402]
C409  4.7u 16V  C_C0805  [C0805]
C410  4.7u 16V  C_C0805  [C0805]
D401  Dual Schottky common anode  BAT54A_215  [SOT23_WAKE]
Q401  P-channel wake drive  AO3401A_8EBFA  [SOT23_WAKE]
R401  30k 1%  R_R0402  [R0402]
R402  33k 1%  R_R0402  [R0402]
R403  100k 1%  R_R0402  [R0402]
R404  47k 1%  R_R0402  [R0402]
R405  4.7k 1%  R_R0402  [R0402]
R406  4.7k 1%  R_R0402  [R0402]
R407  47k 1%  R_R0402  [R0402]
R408  47k 1%  R_R0402  [R0402]
R409  100k 1%  R_R0402  [R0402]
U401  2.8V always-on  TPS7A0228PDBVR  [TI_DBV5_W]
U402  One-shot watchdog  TPL5111DDCR  [TI_DDC6_TPL]
U403  RTC 0x51  PCF85063AT/AY  [NXP_SO8_RTC]
U404  BME280 0x76  BME280  [BOSCH_BME280]
U405  Dual event monostable  74HC123PW_118  [NXP_TSSOP16_MONO]
Y401  32.768 kHz 7pF  Y_ABRACON_ABS07  [ABRACON_ABS07]

### Nets
ANY_KEY_N: U405.9(2A) ; also sheet 7
DONE_2V8: C404.1 R402.2 R403.1 U402.4(DONE)
GND: C401.2 C402.2 C403.2 C404.2 C405.2 C406.2 C407.2 C408.2 C409.2 C410.2 R401.2 R403.2 U401.2(GND) U402.2(GND) U402.6(EN_ONE_SHOT) U403.4(VSS) U404.1(GND1) U404.5(SDO) U404.7(GND2) U405.6(2CEXT) U405.8(GND) U405.14(1CEXT) ; also sheet 2,3,4,5,7
KEY_MONO_RC: C410.1 R408.2 U405.7(2RCEXT)
KEY_PULSE_N: D401.2(K2) U405.12(2Qn)
MAIN_EN: U402.5(DRVn) ; also sheet 2,7
PULSE_GATE_N: D401.3(COM_A) Q401.1(G) R409.2
RTC_IRQ_N: R404.2 U403.3(INTn) U405.1(1A)
RTC_MONO_RC: C409.1 R407.2 U405.15(1RCEXT)
RTC_PULSE_N: D401.1(K1) U405.4(1Qn)
RTC_XI: U403.1(OSCI) Y401.1(XTAL1)
RTC_XO: U403.2(OSCO) Y401.2(XTAL2)
SCL: R405.2 U403.6(SCL) U404.4(SCK) ; also sheet 2,4
SDA: R406.2 U403.5(SDA) U404.3(SDI) ; also sheet 2,4
SYS_AON [power]: C401.1 U401.1(IN) U401.3(EN) ; also sheet 2
TIMER_DONE: R402.1 ; also sheet 4
VAON: C402.1 C403.1 C407.1 C408.1 Q401.2(S) R404.1 R407.1 R408.1 R409.1 U401.5(OUT) U402.1(VDD) U403.8(VDD) U405.2(1B) U405.3(1RDn) U405.10(2B) U405.11(2RDn) U405.16(VCC) ; also sheet 4,7
VMAIN [power]: C405.1 C406.1 R405.1 R406.1 U404.2(CSB) U404.6(VDDIO) U404.8(VDD) ; also sheet 2,4,5,7
WAKE_MDRV: Q401.3(D) R401.1 U402.3(DELAY_MDRV) ; also sheet 4
Unconnected: U401.4(NC) U403.7(CLKOUT) U405.5(2Q) U405.13(1Q)

### Notes on the sheet
- ASTRA   /   SOLAR WEATHER STATION | PROTOTYPE  A  /  SHEET  06  OF  07
- Wake timing, clock and ambient sensor
- Always-on timer, calendar alarm, environmental sensor and wake pulse
- ALWAYS-ON SUPPLY | CLOCK AND ALARM | WAKE PULSE
- WAKE TIMER
- AMBIENT SENSOR
- Identical net labels connect across sheets.   |   Pin numbers refer to the top-side package.

## Sheet 7 of 7: User controls and battery measurement
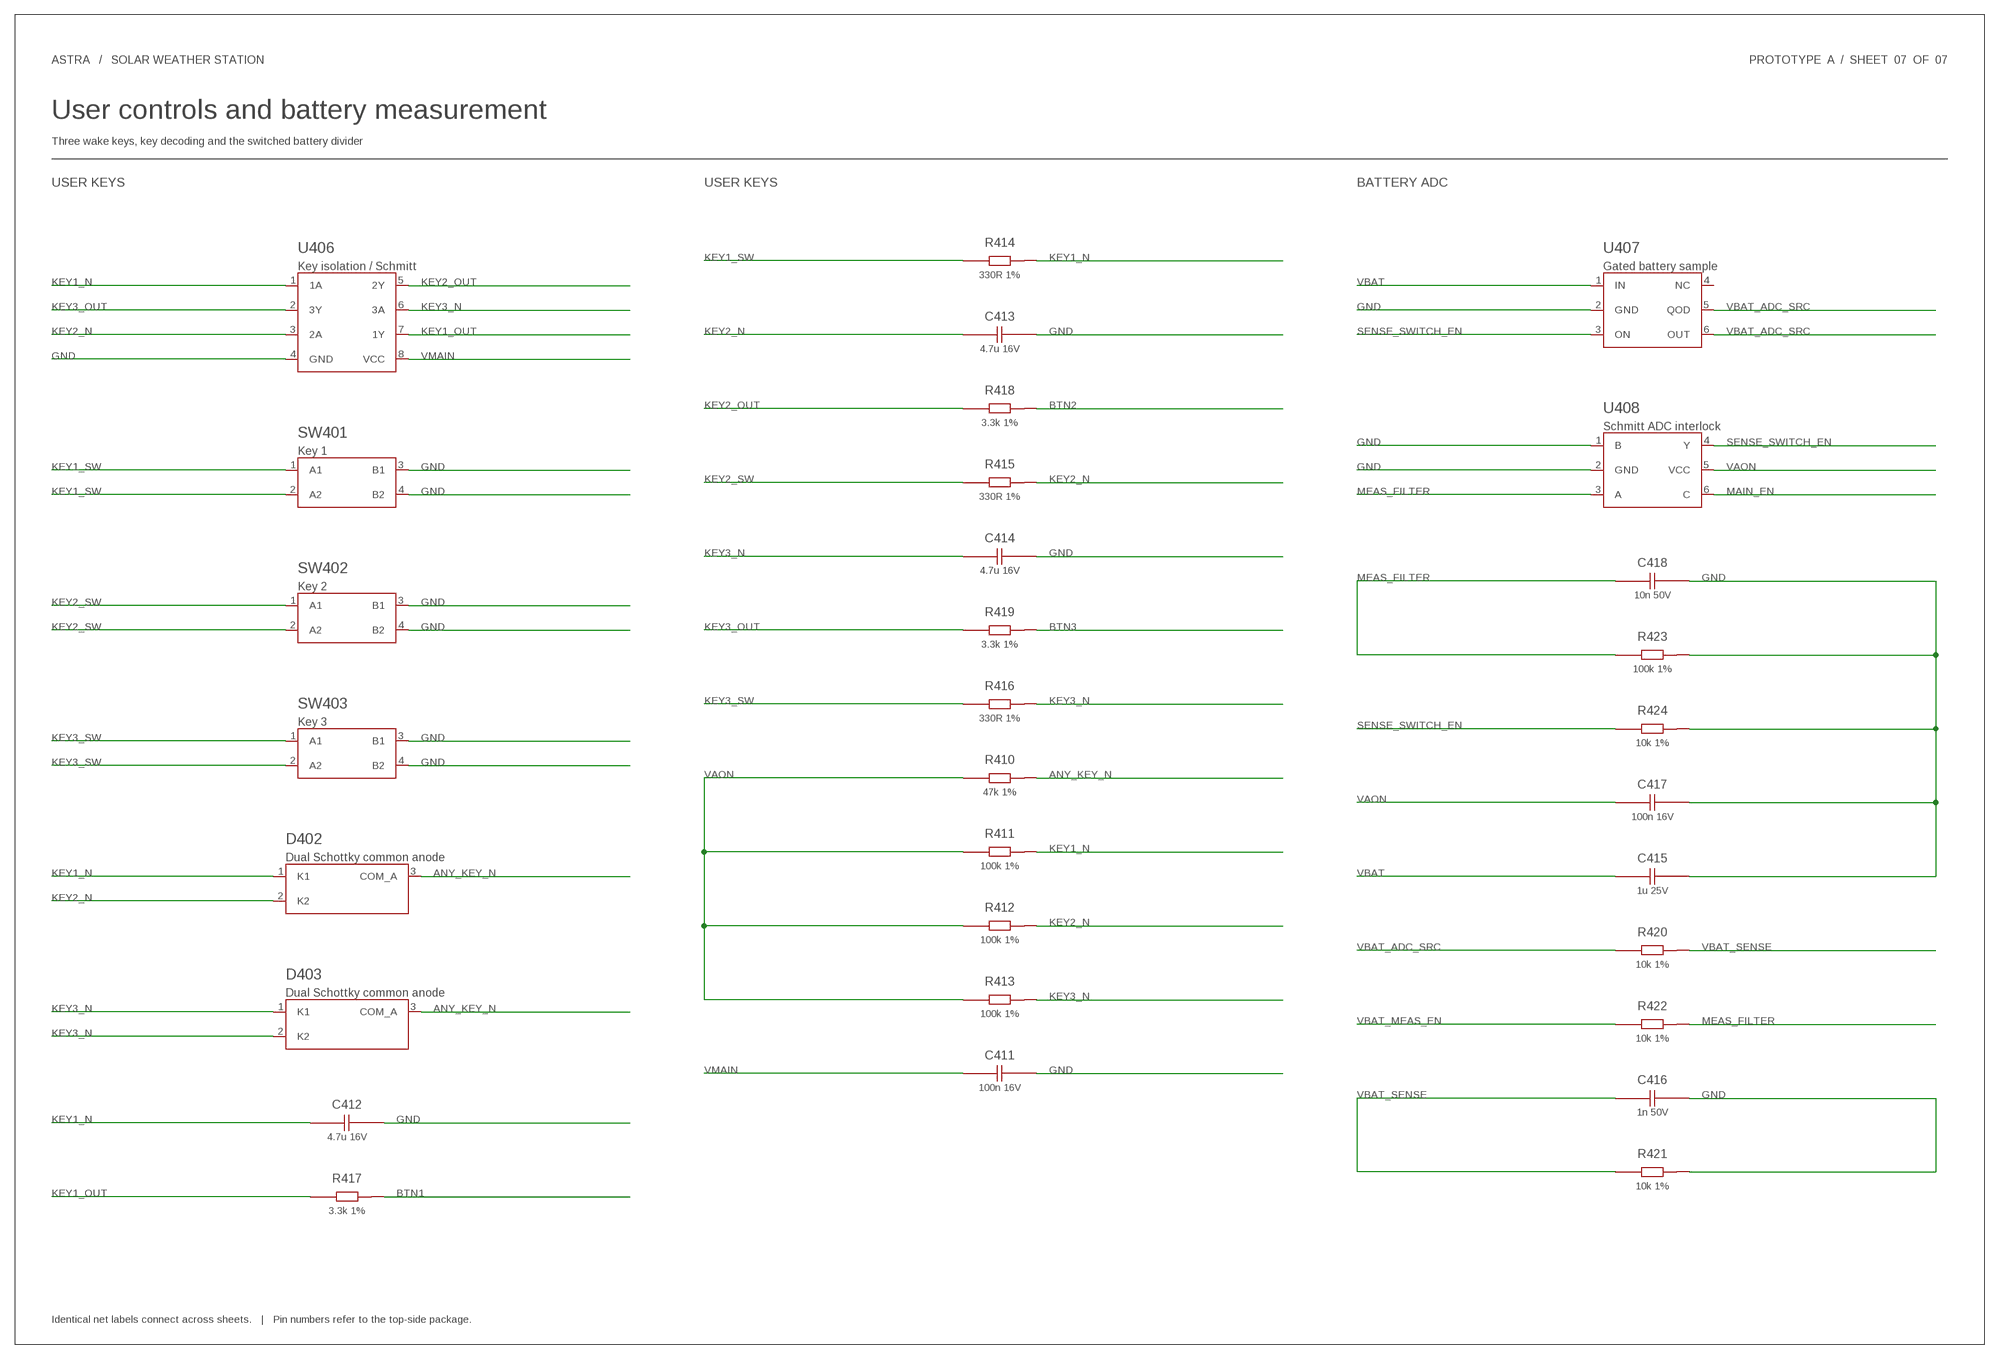
[diagram p6: schematic, sheet 7]

### Parts
C411  100n 16V  C_C0402  [C0402]
C412  4.7u 16V  C_C0805  [C0805]
C413  4.7u 16V  C_C0805  [C0805]
C414  4.7u 16V  C_C0805  [C0805]
C415  1u 25V  C_C0402  [C0402]
C416  1n 50V  C_C0402  [C0402]
C417  100n 16V  C_C0402  [C0402]
C418  10n 50V  C_C0402  [C0402]
D402  Dual Schottky common anode  BAT54A_215  [SOT23_WAKE]
D403  Dual Schottky common anode  BAT54A_215  [SOT23_WAKE]
R410  47k 1%  R_R0402  [R0402]
R411  100k 1%  R_R0402  [R0402]
R412  100k 1%  R_R0402  [R0402]
R413  100k 1%  R_R0402  [R0402]
R414  330R 1%  R_R0402  [R0402]
R415  330R 1%  R_R0402  [R0402]
R416  330R 1%  R_R0402  [R0402]
R417  3.3k 1%  R_R0402  [R0402]
R418  3.3k 1%  R_R0402  [R0402]
R419  3.3k 1%  R_R0402  [R0402]
R420  10k 1%  R_R0402  [R0402]
R421  10k 1%  R_R0402  [R0402]
R422  10k 1%  R_R0402  [R0402]
R423  100k 1%  R_R0402  [R0402]
R424  10k 1%  R_R0402  [R0402]
SW401  Key 1  SKRPABE010  [ALPS_SKRP]
SW402  Key 2  SKRPABE010  [ALPS_SKRP]
SW403  Key 3  SKRPABE010  [ALPS_SKRP]
U406  Key isolation / Schmitt  SN74AUP3G14DCUR  [TI_DCU8_KEY]
U407  Gated battery sample  TPS22919DCKR  [TI_DCK6_SENSE]
U408  Schmitt ADC interlock  SN74AUP1G97DCKR  [TI_DCK6_SENSE]

### Nets
ANY_KEY_N: D402.3(COM_A) D403.3(COM_A) R410.2 ; also sheet 6
BTN1: R417.2 ; also sheet 4
BTN2: R418.2 ; also sheet 4
BTN3: R419.2 ; also sheet 4
GND: C411.2 C412.2 C413.2 C414.2 C415.2 C416.2 C417.2 C418.2 R421.2 R423.2 R424.2 SW401.3(B1) SW401.4(B2) SW402.3(B1) SW402.4(B2) SW403.3(B1) SW403.4(B2) U406.4(GND) U407.2(GND) U408.1(B) U408.2(GND) ; also sheet 2,3,4,5,6
KEY1_N: C412.1 D402.1(K1) R411.2 R414.2 U406.1(1A)
KEY1_OUT: R417.1 U406.7(1Y)
KEY1_SW: R414.1 SW401.1(A1) SW401.2(A2)
KEY2_N: C413.1 D402.2(K2) R412.2 R415.2 U406.3(2A)
KEY2_OUT: R418.1 U406.5(2Y)
KEY2_SW: R415.1 SW402.1(A1) SW402.2(A2)
KEY3_N: C414.1 D403.1(K1) D403.2(K2) R413.2 R416.2 U406.6(3A)
KEY3_OUT: R419.1 U406.2(3Y)
KEY3_SW: R416.1 SW403.1(A1) SW403.2(A2)
MAIN_EN: U408.6(C) ; also sheet 2,6
MEAS_FILTER: C418.1 R422.2 R423.1 U408.3(A)
SENSE_SWITCH_EN: R424.1 U407.3(ON) U408.4(Y)
VAON: C417.1 R410.1 R411.1 R412.1 R413.1 U408.5(VCC) ; also sheet 4,6
VBAT [power]: C415.1 U407.1(IN) ; also sheet 2
VBAT_ADC_SRC: R420.1 U407.5(QOD) U407.6(OUT)
VBAT_MEAS_EN: R422.1 ; also sheet 4
VBAT_SENSE: C416.1 R420.2 R421.1 ; also sheet 4
VMAIN [power]: C411.1 U406.8(VCC) ; also sheet 2,4,5,6
Unconnected: U407.4(NC)

### Notes on the sheet
- ASTRA   /   SOLAR WEATHER STATION | PROTOTYPE  A  /  SHEET  07  OF  07
- User controls and battery measurement
- Three wake keys, key decoding and the switched battery divider
- USER KEYS | USER KEYS | BATTERY ADC
- Identical net labels connect across sheets.   |   Pin numbers refer to the top-side package.

## Library data of the parts
C101 C105 C108 C111 = ASTRA:C_C0402; LCSC: C29266; MPN: CL05A105KO5NNNC
C102 C103 = ASTRA:C_C0603; LCSC: C77045; MPN: GRM188R61C475KE11D
C104 = ASTRA:C_C0402; LCSC: C318576; MPN: CL05B103KA5NNNC
C106 C107 = ASTRA:C_C1206P; LCSC: C426659; MPN: GRM31CR61A476KE15L
C109 C110 C113 = ASTRA:C_C0603; LCSC: C5116073; MPN: GRM188R61C226ME01D
C112 C114 C201 C304 C403 C405-C408 C411 C417 = ASTRA:C_C0402; LCSC: C1525; MPN: CL05B104KO5NNNC
C115 C116 = ASTRA:C_C0603; LCSC: C84419; MPN: GRM188R61A226ME15D
C202 C305 C415 = ASTRA:C_C0402; LCSC: C52923; MPN: CL05A105KA5NQNC
C203 = ASTRA:C_C0402; LCSC: C1562; MPN: 0402CG330J500NT
C301 = ASTRA:C_EPD_C1210; LCSC: C47783; MPN: CL32B475KBJNNNE
C302 = ASTRA:C_C0805; LCSC: C1779; MPN: CL21A475KAQNNNE
C303 C306 C307 C309 C311 = ASTRA:C_C0805; LCSC: C28323; MPN: CL21B105KBFNNNE
C308 C310 = ASTRA:C_EPD_C1206; LCSC: C13832; MPN: CL31B105KCHNNNE
C401 C402 C409 C410 C412-C414 = ASTRA:C_C0805; LCSC: C107365; MPN: CL21B475KOFNNNE
C404 C418 = ASTRA:C_C0402; LCSC: C15195; MPN: CL05B103KB5NNNC
C416 = ASTRA:C_C0402; LCSC: C1523; MPN: 0402B102K500NT
D101 = ASTRA:USBLC6-2SC6; LCSC: C7519; MPN: USBLC6-2SC6
D102 = ASTRA:D_NXP_CFP3_DIODE; LCSC: C82288; MPN: PMEG2010ER,115
D103 = ASTRA:BAT54C_215; LCSC: C37704; MPN: BAT54C,215
D301-D303 = ASTRA:D_MBR0530_CASE425; LCSC: C82046; MPN: MBR0530T1G
D401-D403 = ASTRA:BAT54A_215; LCSC: C130910; MPN: BAT54A,215
J101 = ASTRA:USB4135-GF-A; LCSC: C5438410; MPN: USB4135-GF-A
J102 = ASTRA:BM03B-ACHSS-GAN-ETF_LF__SN; LCSC: C5118705; MPN: BM03B-ACHSS-GAN-ETF(LF)(SN)
J103 = ASTRA:PCB-FEATURE; MPN: PCB-FEATURE
J201 = ASTRA:PCB_pads_only; MPN: PCB pads only
J301 = ASTRA:FH12-24S-0.5SH_55; LCSC: C202112; MPN: FH12-24S-0.5SH(55)
L101 = ASTRA:L_BOURNS_SRN3015; LCSC: C2918094; MPN: SRN3015-220M
L102 = ASTRA:L_COIL_XGL4015; LCSC: C5452431; MPN: XGL4015-471MEC
L301 = ASTRA:L_SRN4018; LCSC: C503307; MPN: SRN4018-100M
Q101 = ASTRA:AO3401A; LCSC: C15127; MPN: AO3401A
Q301 = ASTRA:BSS138LT1G; LCSC: C82045; MPN: BSS138LT1G
Q401 = ASTRA:AO3401A_8EBFA; LCSC: C15127; MPN: AO3401A
R101 R102 = ASTRA:R_R0402; LCSC: C25905; MPN: 0402WGF5101TCE
R103 = ASTRA:R_R0402; LCSC: C25775; MPN: 0402WGF3013TCE
R104 R303-R305 R403 R409 R411-R413 R423 = ASTRA:R_R0402; LCSC: C25741; MPN: 0402WGF1003TCE
R105 R108 = ASTRA:R_R0402; LCSC: C620473; MPN: 0402WGF6804TCE
R106 = ASTRA:R_R0402; LCSC: C45956; MPN: 0402WGF3603TCE
R107 R109 = ASTRA:R_R0402; LCSC: C22276; MPN: 0402WGF1504TCE
R110 = ASTRA:R_R0402; LCSC: C270621; MPN: 0402WGF2704TCE
R111 R122 = ASTRA:R_R0402; LCSC: C26083; MPN: 0402WGF1004TCE
R112 R201 R301 R420-R422 R424 = ASTRA:R_R0402; LCSC: C25744; MPN: 0402WGF1002TCE
R113 = ASTRA:R_R0402; LCSC: C4109; MPN: 0402WGF2001TCE
R114 = ASTRA:R_R0402; LCSC: C36871; MPN: 0402WGF6802TCE
R115 = ASTRA:R_R0402; LCSC: C270576; MPN: 0402WGF8661TCE
R116 R118-R120 = ASTRA:R_R0402; LCSC: C25768; MPN: 0402WGF2202TCE
R117 = ASTRA:R_R0402; LCSC: C37825; MPN: 0402WGF6202TCE
R123 R405 R406 = ASTRA:R_R0402; LCSC: C25900; MPN: 0402WGF4701TCE
R124-R126 = ASTRA:R_R0603; LCSC: C122704; MPN: ERJ3GEY0R00V
R302 = ASTRA:R_R0603; LCSC: C137724; MPN: RC0603FR-073RL
R401 = ASTRA:R_R0402; LCSC: C25776; MPN: 0402WGF3002TCE
R402 = ASTRA:R_R0402; LCSC: C25779; MPN: 0402WGF3302TCE
R404 R407 R408 R410 = ASTRA:R_R0402; LCSC: C25792; MPN: 0402WGF4702TCE
R414-R416 = ASTRA:R_R0402; LCSC: C25104; MPN: 0402WGF3300TCE
R417-R419 = ASTRA:R_R0402; LCSC: C25890; MPN: 0402WGF3301TCE
SW401-SW403 = ASTRA:SKRPABE010; LCSC: C115360; MPN: SKRPABE010
TP101-TP106 = ASTRA:TP_TP; MPN: PCB-FEATURE
TP301 = ASTRA:TP_TP_4BE49; MPN: PCB test land
TP302 = ASTRA:TP_TP_CC413; MPN: PCB test land
U101 = ASTRA:SPV1050TTR; LCSC: C5181469; MPN: SPV1050TTR
U102 = ASTRA:BQ24074RGTR; LCSC: C54313; MPN: BQ24074RGTR
U103 = ASTRA:TPS2116DRLR; LCSC: C3235557; MPN: TPS2116DRLR
U104 = ASTRA:RT6160AWSC; LCSC: C7065276; MPN: RT6160AWSC
U105 = ASTRA:MCP6542-I/MS; LCSC: C636338; MPN: MCP6542-I/MS
U201 = ASTRA:E73-2G4M08S1F; LCSC: C54337734; MPN: E73-2G4M08S1F
U401 = ASTRA:TPS7A0228PDBVR; LCSC: C5220176; MPN: TPS7A0228PDBVR
U402 = ASTRA:TPL5111DDCR; LCSC: C2870554; MPN: TPL5111DDCR
U403 = ASTRA:PCF85063AT/AY; LCSC: C5151540; MPN: PCF85063AT/AY
U404 = ASTRA:BME280; LCSC: C92489; MPN: BME280
U405 = ASTRA:74HC123PW_118; LCSC: C426698; MPN: 74HC123PW,118
U406 = ASTRA:SN74AUP3G14DCUR; LCSC: C2863927; MPN: SN74AUP3G14DCUR
U407 = ASTRA:TPS22919DCKR; LCSC: C2149796; MPN: TPS22919DCKR
U408 = ASTRA:SN74AUP1G97DCKR; LCSC: C2682139; MPN: SN74AUP1G97DCKR
Y401 = ASTRA:Y_ABRACON_ABS07; LCSC: C1985277; MPN: ABS07-32.768KHZ-7-1-T

## Net classes
1 power: width 0.3 mm